# Altium project EXPLORER_V3.PrjPCB
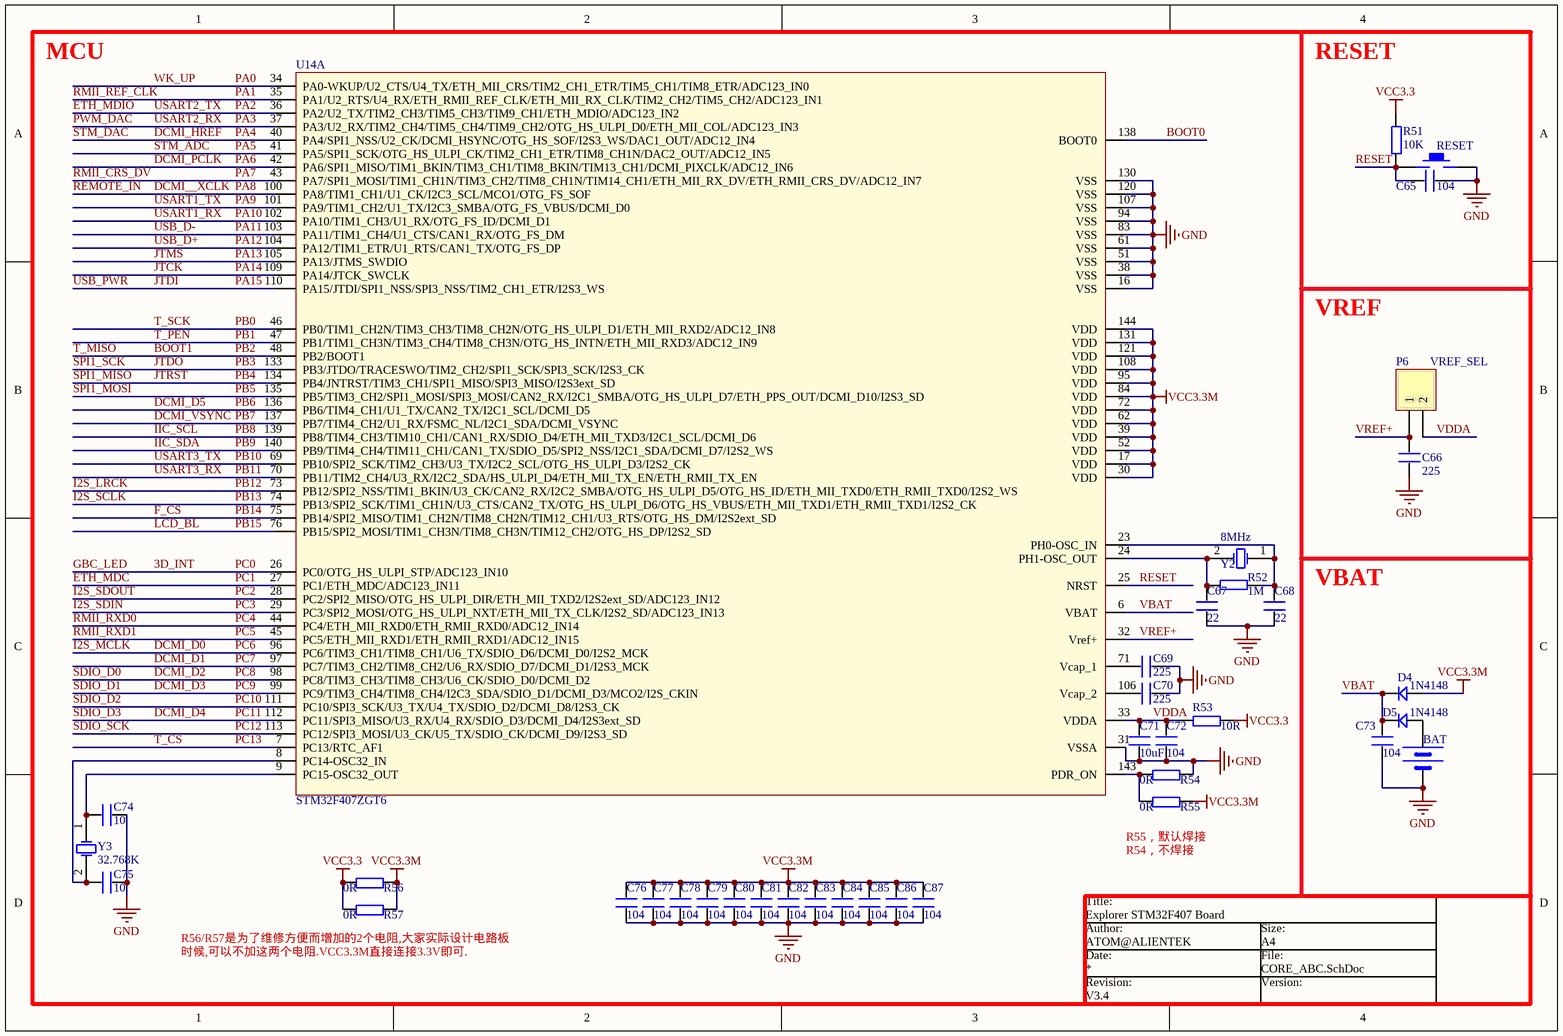
[diagram p0: CORE_ABC.SchDoc]
6 sheets, 254 parts. Net scope: global (net labels, ports and power ports of the same name join across sheets).
Board file: EXPLORER_V3.4.PcbDoc
Sheets:
  CORE_ABC.SchDoc
  CORE_DEFG.SchDoc
  DEVICE1.SchDoc
  DEVICE2.SchDoc
  AUDIO&ETHNET.SchDoc
  POWER&USB_USART.SchDoc

## Sheet CORE_ABC.SchDoc: Explorer STM32F407 Board
size A4; Author: ATOM@ALIENTEK; Revision: V3.4; SheetSize: A4

### Parts
BAT  BATT  [BATM]  (value not drawn)
C65  104  [0402]
C66  225  [0402]
C67  22  [0402]
C68  22  [0402]
C69  225  [0402]
C70  225  [0402]
C71  10uF  [0603P]
C72  104  [0402]
C73  104  [0402]
C74  10  [0402]
C75  10  [0402]
C76  104  [0402]
C77  104  [0402]
C78  104  [0402]
C79  104  [0402]
C80  104  [0402]
C81  104  [0402]
C82  104  [0402]
C83  104  [0402]
C84  104  [0402]
C85  104  [0402]
C86  104  [0402]
C87  104  [0402]
D4  1N4148  [DIODE_SOP]
D5  1N4148  [DIODE_SOP]
P6  VREF_SEL  [HDR1X2]
R51  10K  [0402]
R52  1M  [0402]
R53  10R  [0402]
R54  0R  [0402]
R55  0R  [0402]
R56  0R  [0402]
R57  0R  [0402]
RESET  KEY_M  [KEY_M]  (value not drawn)
U14  STM32F407ZGT6  [LQFP144]  (part A of 2)
Y2  8MHz  [XTAL_US]
Y3  32.768K  [XTAL32]

### Nets
GND: BAT.2(GND) C65.1 C66.1 C67.1 C68.1 C69.2 C70.2 C71.1 C72.1 C73.2 C74.1 C75.1 C76.1 C77.1 C78.1 C79.1 C80.1 C81.1 C82.1 C83.1 C84.1 C85.1 C86.1 C87.1 R54.2 RESET.2 U14.16(VSS) U14.31(VSSA) U14.38(VSS) U14.51(VSS) U14.61(VSS) U14.83(VSS) U14.94(VSS) U14.107(VSS) U14.120(VSS) U14.130(VSS)
VCC3.3: R51.2 R53.2 R56.1 R57.1
VCC3.3M: C76.2 C77.2 C78.2 C79.2 C80.2 C81.2 C82.2 C83.2 C84.2 C85.2 C86.2 C87.2 D4.1 R55.2 R56.2 R57.2 U14.17(VDD) U14.30(VDD) U14.39(VDD) U14.52(VDD) U14.62(VDD) U14.72(VDD) U14.84(VDD) U14.95(VDD) U14.108(VDD) U14.121(VDD) U14.131(VDD) U14.144(VDD)
3D_INT: U14.26(PC0/OTG_HS_ULPI_STP/ADC123_IN10)  [also labelled GBC_LED, PC0]
BOOT0: U14.138(BOOT0)
BOOT1: U14.48(PB2/BOOT1)  [also labelled PB2, T_MISO]
DCMI__XCLK: U14.100(PA8/TIM1_CH1/U1_CK/I2C3_SCL/MCO1/OTG_FS_SOF)  [also labelled PA8, REMOTE_IN]
DCMI_D0: U14.96(PC6/TIM3_CH1/TIM8_CH1/U6_TX/SDIO_D6/DCMI_D0/I2S2_MCK)  [also labelled I2S_MCLK, PC6]
DCMI_D1: U14.97(PC7/TIM3_CH2/TIM8_CH2/U6_RX/SDIO_D7/DCMI_D1/I2S3_MCK)  [also labelled PC7]
DCMI_D2: U14.98(PC8/TIM3_CH3/TIM8_CH3/U6_CK/SDIO_D0/DCMI_D2)  [also labelled PC8, SDIO_D0]
DCMI_D3: U14.99(PC9/TIM3_CH4/TIM8_CH4/I2C3_SDA/SDIO_D1/DCMI_D3/MCO2/I2S_CKIN)  [also labelled PC9, SDIO_D1]
DCMI_D4: U14.112(PC11/SPI3_MISO/U3_RX/U4_RX/SDIO_D3/DCMI_D4/I2S3ext_SD)  [also labelled PC11, SDIO_D3]
DCMI_D5: U14.136(PB6/TIM4_CH1/U1_TX/CAN2_TX/I2C1_SCL/DCMI_D5)  [also labelled PB6]
DCMI_HREF: U14.40(PA4/SPI1_NSS/U2_CK/DCMI_HSYNC/OTG_HS_SOF/I2S3_WS/DAC1_OUT/ADC12_IN4)  [also labelled PA4, STM_DAC]
DCMI_PCLK: U14.42(PA6/SPI1_MISO/TIM1_BKIN/TIM3_CH1/TIM8_BKIN/TIM13_CH1/DCMI_PIXCLK/ADC12_IN6)  [also labelled PA6]
DCMI_VSYNC: U14.137(PB7/TIM4_CH2/U1_RX/FSMC_NL/I2C1_SDA/DCMI_VSYNC)  [also labelled PB7]
ETH_MDC: U14.27(PC1/ETH_MDC/ADC123_IN11)  [also labelled PC1]
ETH_MDIO: U14.36(PA2/U2_TX/TIM2_CH3/TIM5_CH3/TIM9_CH1/ETH_MDIO/ADC123_IN2)  [also labelled PA2, USART2_TX]
F_CS: U14.75(PB14/SPI2_MISO/TIM1_CH2N/TIM8_CH2N/TIM12_CH1/U3_RTS/OTG_HS_DM/I2S2ext_SD)  [also labelled PB14]
I2S_LRCK: U14.73(PB12/SPI2_NSS/TIM1_BKIN/U3_CK/CAN2_RX/I2C2_SMBA/OTG_HS_ULPI_D5/OTG_HS_ID/ETH_MII_TXD0/ETH_RMII_TXD0/I2S2_WS)  [also labelled PB12]
I2S_SCLK: U14.74(PB13/SPI2_SCK/TIM1_CH1N/U3_CTS/CAN2_TX/OTG_HS_ULPI_D6/OTG_HS_VBUS/ETH_MII_TXD1/ETH_RMII_TXD1/I2S2_CK)  [also labelled PB13]
I2S_SDIN: U14.29(PC3/SPI2_MOSI/OTG_HS_ULPI_NXT/ETH_MII_TX_CLK/I2S2_SD/ADC123_IN13)  [also labelled PC3]
I2S_SDOUT: U14.28(PC2/SPI2_MISO/OTG_HS_ULPI_DIR/ETH_MII_TXD2/I2S2ext_SD/ADC123_IN12)  [also labelled PC2]
IIC_SCL: U14.139(PB8/TIM4_CH3/TIM10_CH1/CAN1_RX/SDIO_D4/ETH_MII_TXD3/I2C1_SCL/DCMI_D6)  [also labelled PB8]
IIC_SDA: U14.140(PB9/TIM4_CH4/TIM11_CH1/CAN1_TX/SDIO_D5/SPI2_NSS/I2C1_SDA/DCMI_D7/I2S2_WS)  [also labelled PB9]
JTCK: U14.109(PA14/JTCK_SWCLK)  [also labelled PA14]
JTDI: U14.110(PA15/JTDI/SPI1_NSS/SPI3_NSS/TIM2_CH1_ETR/I2S3_WS)  [also labelled PA15, USB_PWR]
JTDO: U14.133(PB3/JTDO/TRACESWO/TIM2_CH2/SPI1_SCK/SPI3_SCK/I2S3_CK)  [also labelled PB3, SPI1_SCK]
JTMS: U14.105(PA13/JTMS_SWDIO)  [also labelled PA13]
JTRST: U14.134(PB4/JNTRST/TIM3_CH1/SPI1_MISO/SPI3_MISO/I2S3ext_SD)  [also labelled PB4, SPI1_MISO]
LCD_BL: U14.76(PB15/SPI2_MOSI/TIM1_CH3N/TIM8_CH3N/TIM12_CH2/OTG_HS_DP/I2S2_SD)  [also labelled PB15]
PA0: U14.34(PA0-WKUP/U2_CTS/U4_TX/ETH_MII_CRS/TIM2_CH1_ETR/TIM5_CH1/TIM8_ETR/ADC123_IN0)  [also labelled WK_UP]
PA1: U14.35(PA1/U2_RTS/U4_RX/ETH_RMII_REF_CLK/ETH_MII_RX_CLK/TIM2_CH2/TIM5_CH2/ADC123_IN1)  [also labelled RMII_REF_CLK]
PA3: U14.37(PA3/U2_RX/TIM2_CH4/TIM5_CH4/TIM9_CH2/OTG_HS_ULPI_D0/ETH_MII_COL/ADC123_IN3)  [also labelled PWM_DAC, USART2_RX]
PA5: U14.41(PA5/SPI1_SCK/OTG_HS_ULPI_CK/TIM2_CH1_ETR/TIM8_CH1N/DAC2_OUT/ADC12_IN5)  [also labelled STM_ADC]
PA7: U14.43(PA7/SPI1_MOSI/TIM1_CH1N/TIM3_CH2/TIM8_CH1N/TIM14_CH1/ETH_MII_RX_DV/ETH_RMII_CRS_DV/ADC12_IN7)  [also labelled RMII_CRS_DV]
PA9: U14.101(PA9/TIM1_CH2/U1_TX/I2C3_SMBA/OTG_FS_VBUS/DCMI_D0)  [also labelled USART1_TX]
PA10: U14.102(PA10/TIM1_CH3/U1_RX/OTG_FS_ID/DCMI_D1)  [also labelled USART1_RX]
PA11: U14.103(PA11/TIM1_CH4/U1_CTS/CAN1_RX/OTG_FS_DM)  [also labelled USB_D-]
PA12: U14.104(PA12/TIM1_ETR/U1_RTS/CAN1_TX/OTG_FS_DP)  [also labelled USB_D+]
PB0: U14.46(PB0/TIM1_CH2N/TIM3_CH3/TIM8_CH2N/OTG_HS_ULPI_D1/ETH_MII_RXD2/ADC12_IN8)  [also labelled T_SCK]
PB1: U14.47(PB1/TIM1_CH3N/TIM3_CH4/TIM8_CH3N/OTG_HS_INTN/ETH_MII_RXD3/ADC12_IN9)  [also labelled T_PEN]
PB5: U14.135(PB5/TIM3_CH2/SPI1_MOSI/SPI3_MOSI/CAN2_RX/I2C1_SMBA/OTG_HS_ULPI_D7/ETH_PPS_OUT/DCMI_D10/I2S3_SD)  [also labelled SPI1_MOSI]
PB10: U14.69(PB10/SPI2_SCK/TIM2_CH3/U3_TX/I2C2_SCL/OTG_HS_ULPI_D3/I2S2_CK)  [also labelled USART3_TX]
PB11: U14.70(PB11/TIM2_CH4/U3_RX/I2C2_SDA/HS_ULPI_D4/ETH_MII_TX_EN/ETH_RMII_TX_EN)  [also labelled USART3_RX]
PC4: U14.44(PC4/ETH_MII_RXD0/ETH_RMII_RXD0/ADC12_IN14)  [also labelled RMII_RXD0]
PC5: U14.45(PC5/ETH_MII_RXD1/ETH_RMII_RXD1/ADC12_IN15)  [also labelled RMII_RXD1]
PC10: U14.111(PC10/SPI3_SCK/U3_TX/U4_TX/SDIO_D2/DCMI_D8/I2S3_CK)  [also labelled SDIO_D2]
PC12: U14.113(PC12/SPI3_MOSI/U3_CK/U5_TX/SDIO_CK/DCMI_D9/I2S3_SD)  [also labelled SDIO_SCK]
PC13: U14.7(PC13/RTC_AF1)  [also labelled T_CS]
RESET: C65.2 R51.1 RESET.1 U14.25(NRST)
VBAT: C73.1 D4.2 D5.2 U14.6(VBAT)
VDDA: C71.2 C72.2 P6.2 R53.1 U14.33(VDDA)
VREF+: C66.2 P6.1 U14.32(Vref+)
NetBAT_1: BAT.1(VCC) D5.1
NetC67_2: C67.2 R52.2 U14.24(PH1-OSC_OUT) Y2.2(OSC2)
NetC68_2: C68.2 R52.1 U14.23(PH0-OSC_IN) Y2.1(OSC1)
NetC69_1: C69.1 U14.71(Vcap_1)
NetC70_1: C70.1 U14.106(Vcap_2)
NetC74_2: C74.2 U14.9(PC15-OSC32_OUT) Y3.1(OSC1)
NetC75_2: C75.2 U14.8(PC14-OSC32_IN) Y3.2(OSC2)
NetR54_1: R54.1 R55.1 U14.143(PDR_ON)

### Notes on the sheet
- MCU
- RESET
- VREF
- (near C68) VBAT
- (near R55) R55，默认焊接
  R54，不焊接
- (near R57) R56/R57是为了维修方便而增加的2个电阻,大家实际设计电路板
  时候,可以不加这两个电阻.VCC3.3M直接连接3.3V即可.
- Title:
- Author:
- Date:
- Revision:
- Size:
- File:
- Version:

### Library data of the parts
BAT = BAT
C65-C87 = C
D4 D5 = D
P6 = Header 2: Header, 2-Pin; LatestRevisionDate: 17-Jul-2002; LatestRevisionNote: Re-released for DXP Platform.; Publisher: Altium Limited
R51-R57 = R
U14 = STM32F407ZET6
Y2 Y3 = XTAL: Crystal Oscillator; Published: 8-Jun-2000; LatestRevisionDate: 17-Jul-2002; LatestRevisionNote: Re-released for DXP Platform.; Publisher: Altium Limited

## Sheet CORE_DEFG.SchDoc: Explorer STM32F407 Board
size A4; Author: ATOM@ALIENTEK; Revision: V3.4; SheetSize: A4
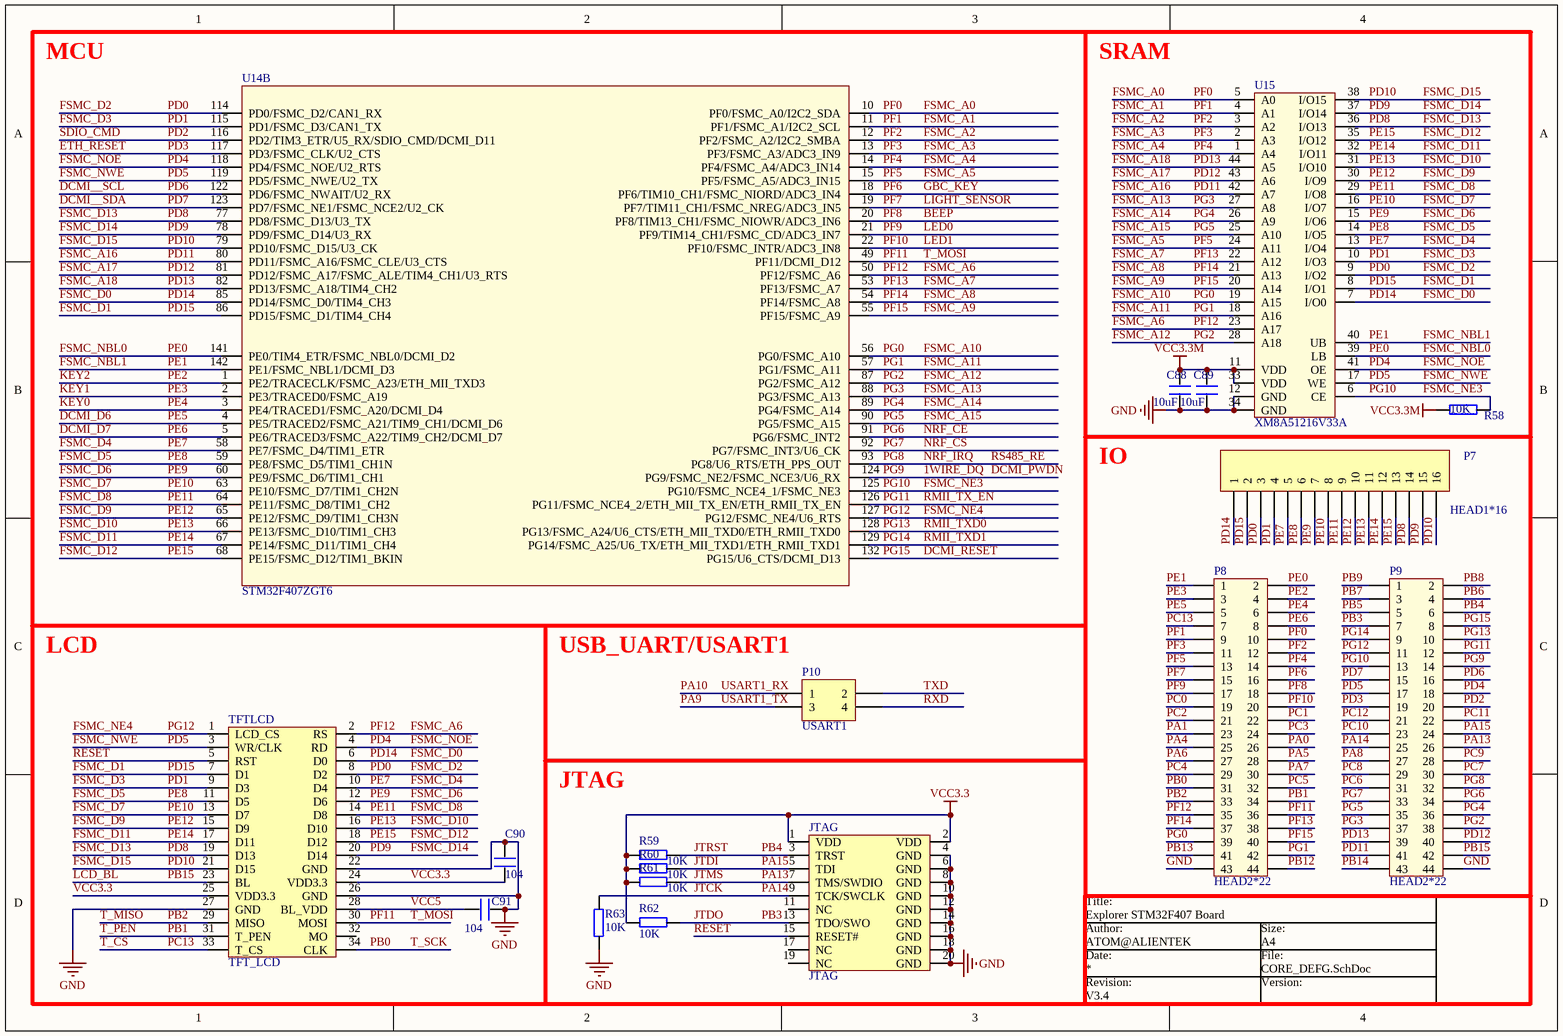
[diagram p1: CORE_DEFG.SchDoc]

### Parts
C88  10uF  [0402]
C89  10uF  [0402]
C90  104  [0402]
C91  104  [0402]
JTAG  JTAG  [JTAG_20]
P7  HEAD1*16  [HDR1X16]
P8  HEAD2*22  [HEAD2*22]
P9  HEAD2*22  [HEAD2*22]
P10  USART1  [HDR2X2]
R58  10K  [0402]
R59  10K  [0402]
R60  10K  [0402]
R61  10K  [0402]
R62  10K  [0402]
R63  10K  [0402]
TFTLCD  TFT_LCD  [db2*17-4.3]
U14  STM32F407ZGT6  [LQFP144]  (part B of 2)
U15  XM8A51216V33A  [TSOP44]

### Nets
GND: C88.1 C89.1 C90.2 C91.1 JTAG.4(GND) JTAG.6(GND) JTAG.8(GND) JTAG.10(GND) JTAG.12(GND) JTAG.14(GND) JTAG.16(GND) JTAG.18(GND) JTAG.20(GND) P8.43 P9.44 R63.2 TFTLCD.22(GND) TFTLCD.26(GND) TFTLCD.27(GND) U15.12(GND) U15.34(GND)
VCC3.3: C90.1 JTAG.1(VDD) JTAG.2(VDD) R59.2 R60.2 R61.2 R62.2 TFTLCD.24(VDD3.3) TFTLCD.25(VDD3.3)
VCC3.3M: C88.2 C89.2 R58.2 U15.11(VDD) U15.33(VDD)
VCC5: C91.2 TFTLCD.28(BL_VDD)
1WIRE_DQ: P9.14 U14.124(PG9/FSMC_NE2/FSMC_NCE3/U6_RX)  [also labelled DCMI_PWDN, PG9]
BEEP: P8.18 U14.20(PF8/TIM13_CH1/FSMC_NIOWR/ADC3_IN6)  [also labelled PF8]
DCMI__SCL: P9.16 U14.122(PD6/FSMC_NWAIT/U2_RX)  [also labelled PD6]
DCMI__SDA: P9.15 U14.123(PD7/FSMC_NE1/FSMC_NCE2/U2_CK)  [also labelled PD7]
DCMI_D6: P8.5 U14.4(PE5/TRACED2/FSMC_A21/TIM9_CH1/DCMI_D6)  [also labelled PE5]
DCMI_D7: P8.8 U14.5(PE6/TRACED3/FSMC_A22/TIM9_CH2/DCMI_D7)  [also labelled PE6]
DCMI_RESET: P9.8 U14.132(PG15/U6_CTS/DCMI_D13)  [also labelled PG15]
ETH_RESET: P9.19 U14.117(PD3/FSMC_CLK/U2_CTS)  [also labelled PD3]
FSMC_A0: P8.10 U14.10(PF0/FSMC_A0/I2C2_SDA) U15.5(A0)  [also labelled PF0]
FSMC_A1: P8.9 U14.11(PF1/FSMC_A1/I2C2_SCL) U15.4(A1)  [also labelled PF1]
FSMC_A2: P8.12 U14.12(PF2/FSMC_A2/I2C2_SMBA) U15.3(A2)  [also labelled PF2]
FSMC_A3: P8.11 U14.13(PF3/FSMC_A3/ADC3_IN9) U15.2(A3)  [also labelled PF3]
FSMC_A4: P8.14 U14.14(PF4/FSMC_A4/ADC3_IN14) U15.1(A4)  [also labelled PF4]
FSMC_A5: P8.13 U14.15(PF5/FSMC_A5/ADC3_IN15) U15.24(A11)  [also labelled PF5]
FSMC_A6: P8.35 TFTLCD.2(RS) U14.50(PF12/FSMC_A6) U15.23(A17)  [also labelled PF12]
FSMC_A7: P8.38 U14.53(PF13/FSMC_A7) U15.22(A12)  [also labelled PF13]
FSMC_A8: P8.37 U14.54(PF14/FSMC_A8) U15.21(A13)  [also labelled PF14]
FSMC_A9: P8.40 U14.55(PF15/FSMC_A9) U15.20(A14)  [also labelled PF15]
FSMC_A10: P8.39 U14.56(PG0/FSMC_A10) U15.19(A15)  [also labelled PG0]
FSMC_A11: P8.42 U14.57(PG1/FSMC_A11) U15.18(A16)  [also labelled PG1]
FSMC_A12: P9.38 U14.87(PG2/FSMC_A12) U15.28(A18)  [also labelled PG2]
FSMC_A13: P9.37 U14.88(PG3/FSMC_A13) U15.27(A8)  [also labelled PG3]
FSMC_A14: P9.36 U14.89(PG4/FSMC_A14) U15.26(A9)  [also labelled PG4]
FSMC_A15: P9.35 U14.90(PG5/FSMC_A15) U15.25(A10)  [also labelled PG5]
FSMC_A16: P9.41 U14.80(PD11/FSMC_A16/FSMC_CLE/U3_CTS) U15.42(A7)  [also labelled PD11]
FSMC_A17: P9.40 U14.81(PD12/FSMC_A17/FSMC_ALE/TIM4_CH1/U3_RTS) U15.43(A6)  [also labelled PD12]
FSMC_A18: P9.39 U14.82(PD13/FSMC_A18/TIM4_CH2) U15.44(A5)  [also labelled PD13]
FSMC_D0: P7.1 TFTLCD.6(D0) U14.85(PD14/FSMC_D0/TIM4_CH3) U15.7(I/O0)  [also labelled PD14]
FSMC_D1: P7.2 TFTLCD.7(D1) U14.86(PD15/FSMC_D1/TIM4_CH4) U15.8(I/O1)  [also labelled PD15]
FSMC_D2: P7.3 TFTLCD.8(D2) U14.114(PD0/FSMC_D2/CAN1_RX) U15.9(I/O2)  [also labelled PD0]
FSMC_D3: P7.4 TFTLCD.9(D3) U14.115(PD1/FSMC_D3/CAN1_TX) U15.10(I/O3)  [also labelled PD1]
FSMC_D4: P7.5 TFTLCD.10(D4) U14.58(PE7/FSMC_D4/TIM1_ETR) U15.13(I/O4)  [also labelled PE7]
FSMC_D5: P7.6 TFTLCD.11(D5) U14.59(PE8/FSMC_D5/TIM1_CH1N) U15.14(I/O5)  [also labelled PE8]
FSMC_D6: P7.7 TFTLCD.12(D6) U14.60(PE9/FSMC_D6/TIM1_CH1) U15.15(I/O6)  [also labelled PE9]
FSMC_D7: P7.8 TFTLCD.13(D7) U14.63(PE10/FSMC_D7/TIM1_CH2N) U15.16(I/O7)  [also labelled PE10]
FSMC_D8: P7.9 TFTLCD.14(D8) U14.64(PE11/FSMC_D8/TIM1_CH2) U15.29(I/O8)  [also labelled PE11]
FSMC_D9: P7.10 TFTLCD.15(D9) U14.65(PE12/FSMC_D9/TIM1_CH3N) U15.30(I/O9)  [also labelled PE12]
FSMC_D10: P7.11 TFTLCD.16(D10) U14.66(PE13/FSMC_D10/TIM1_CH3) U15.31(I/O10)  [also labelled PE13]
FSMC_D11: P7.12 TFTLCD.17(D11) U14.67(PE14/FSMC_D11/TIM1_CH4) U15.32(I/O11)  [also labelled PE14]
FSMC_D12: P7.13 TFTLCD.18(D12) U14.68(PE15/FSMC_D12/TIM1_BKIN) U15.35(I/O12)  [also labelled PE15]
FSMC_D13: P7.14 TFTLCD.19(D13) U14.77(PD8/FSMC_D13/U3_TX) U15.36(I/O13)  [also labelled PD8]
FSMC_D14: P7.15 TFTLCD.20(D14) U14.78(PD9/FSMC_D14/U3_RX) U15.37(I/O14)  [also labelled PD9]
FSMC_D15: P7.16 TFTLCD.21(D15) U14.79(PD10/FSMC_D15/U3_CK) U15.38(I/O15)  [also labelled PD10]
FSMC_NBL0: P8.2 U14.141(PE0/TIM4_ETR/FSMC_NBL0/DCMI_D2) U15.39(LB)  [also labelled PE0]
FSMC_NBL1: P8.1 U14.142(PE1/FSMC_NBL1/DCMI_D3) U15.40(UB)  [also labelled PE1]
FSMC_NE3: P9.13 R58.1 U14.125(PG10/FSMC_NCE4_1/FSMC_NE3) U15.6(CE)  [also labelled PG10]
FSMC_NE4: P9.11 TFTLCD.1(LCD_CS) U14.127(PG12/FSMC_NE4/U6_RTS)  [also labelled PG12]
FSMC_NOE: P9.18 TFTLCD.4(RD) U14.118(PD4/FSMC_NOE/U2_RTS) U15.41(OE)  [also labelled PD4]
FSMC_NWE: P9.17 TFTLCD.3(WR/CLK) U14.119(PD5/FSMC_NWE/U2_TX) U15.17(WE)  [also labelled PD5]
GBC_KEY: P8.16 U14.18(PF6/TIM10_CH1/FSMC_NIORD/ADC3_IN4)  [also labelled PF6]
JTCK: JTAG.9(TCK/SWCLK) P9.25 R63.1  [also labelled PA14]
JTDI: JTAG.5(TDI) P9.24 R60.1  [also labelled PA15]
JTDO: JTAG.13(TDO/SWO) P9.7 R62.1  [also labelled PB3]
JTMS: JTAG.7(TMS/SWDIO) P9.26 R61.1  [also labelled PA13]
JTRST: JTAG.3(TRST) P9.6 R59.1  [also labelled PB4]
KEY0: P8.6 U14.3(PE4/TRACED1/FSMC_A20/DCMI_D4)  [also labelled PE4]
KEY1: P8.3 U14.2(PE3/TRACED0/FSMC_A19)  [also labelled PE3]
KEY2: P8.4 U14.1(PE2/TRACECLK/FSMC_A23/ETH_MII_TXD3)  [also labelled PE2]
LCD_BL: P9.42 TFTLCD.23(BL)  [also labelled PB15]
LED0: P8.17 U14.21(PF9/TIM14_CH1/FSMC_CD/ADC3_IN7)  [also labelled PF9]
LED1: P8.20 U14.22(PF10/FSMC_INTR/ADC3_IN8)  [also labelled PF10]
LIGHT_SENSOR: P8.15 U14.19(PF7/TIM11_CH1/FSMC_NREG/ADC3_IN5)  [also labelled PF7]
NRF_CE: P9.34 U14.91(PG6/FSMC_INT2)  [also labelled PG6]
NRF_CS: P9.33 U14.92(PG7/FSMC_INT3/U6_CK)  [also labelled PG7]
NRF_IRQ: P9.32 U14.93(PG8/U6_RTS/ETH_PPS_OUT)  [also labelled PG8, RS485_RE]
PA0: P8.26
PA1: P8.23
PA4: P8.25  [project net DCMI_HREF]
PA5: P8.28
PA6: P8.27  [project net DCMI_PCLK]
PA7: P8.30
PA8: P9.27  [project net DCMI__XCLK]
PA9: P10.3  [also labelled USART1_TX]
PA10: P10.1  [also labelled USART1_RX]
PB0: P8.31 TFTLCD.34(CLK)  [also labelled T_SCK]
PB1: P8.34 TFTLCD.31(T_PEN)  [also labelled T_PEN]
PB2: P8.33 TFTLCD.29(MISO)  [also labelled T_MISO]  [project net BOOT1]
PB5: P9.5
PB6: P9.4  [project net DCMI_D5]
PB7: P9.3  [project net DCMI_VSYNC]
PB8: P9.2  [project net IIC_SCL]
PB9: P9.1  [project net IIC_SDA]
PB12: P8.44  [project net I2S_LRCK]
PB13: P8.41  [project net I2S_SCLK]
PB14: P9.43  [project net F_CS]
PC0: P8.19  [project net 3D_INT]
PC1: P8.22  [project net ETH_MDC]
PC2: P8.21  [project net I2S_SDOUT]
PC3: P8.24  [project net I2S_SDIN]
PC4: P8.29
PC5: P8.32
PC6: P9.31  [project net DCMI_D0]
PC7: P9.30  [project net DCMI_D1]
PC8: P9.29  [project net DCMI_D2]
PC9: P9.28  [project net DCMI_D3]
PC10: P9.23
PC11: P9.22  [project net DCMI_D4]
PC12: P9.21
PC13: P8.7 TFTLCD.33(T_CS)  [also labelled T_CS]
PD2: P9.20 U14.116(PD2/TIM3_ETR/U5_RX/SDIO_CMD/DCMI_D11)  [also labelled SDIO_CMD]
PF11: P8.36 TFTLCD.30(MOSI) U14.49(PF11/DCMI_D12)  [also labelled T_MOSI]
PG11: P9.12 U14.126(PG11/FSMC_NCE4_2/ETH_MII_TX_EN/ETH_RMII_TX_EN)  [also labelled RMII_TX_EN]
PG13: P9.10 U14.128(PG13/FSMC_A24/U6_CTS/ETH_MII_TXD0/ETH_RMII_TXD0)  [also labelled RMII_TXD0]
PG14: P9.9 U14.129(PG14/FSMC_A25/U6_TX/ETH_MII_TXD1/ETH_RMII_TXD1)  [also labelled RMII_TXD1]
RESET: JTAG.15(RESET#) TFTLCD.5(RST)
RXD: P10.4
TXD: P10.2

Not connected (* = marked no-connect by the designer): JTAG 11(NC) 17(NC) 19(NC); TFTLCD 32(MO)

### Notes on the sheet
- MCU
- SRAM
- IO
- LCD
- USB_UART/USART1
- JTAG
- Title:
- Author:
- Date:
- Revision:
- Size:
- File:
- Version:

### Library data of the parts
C88-C91 = C
P7 = Header 16: Header, 16-Pin; LatestRevisionDate: 17-Jul-2002; LatestRevisionNote: Re-released for DXP Platform.; Publisher: Altium Limited
P10 = Header 2X2: Header, 2-Pin, Dual row; LatestRevisionDate: 17-Jul-2002; LatestRevisionNote: Re-released for DXP Platform.; Publisher: Altium Limited
R58-R63 = R
U14 = STM32F407ZET6
U15 = IS62WV51216

## Sheet DEVICE1.SchDoc: Explorer STM32F407 Board
size A4; Author: ATOM@ALIENTEK; Revision: V3.4; SheetSize: A4
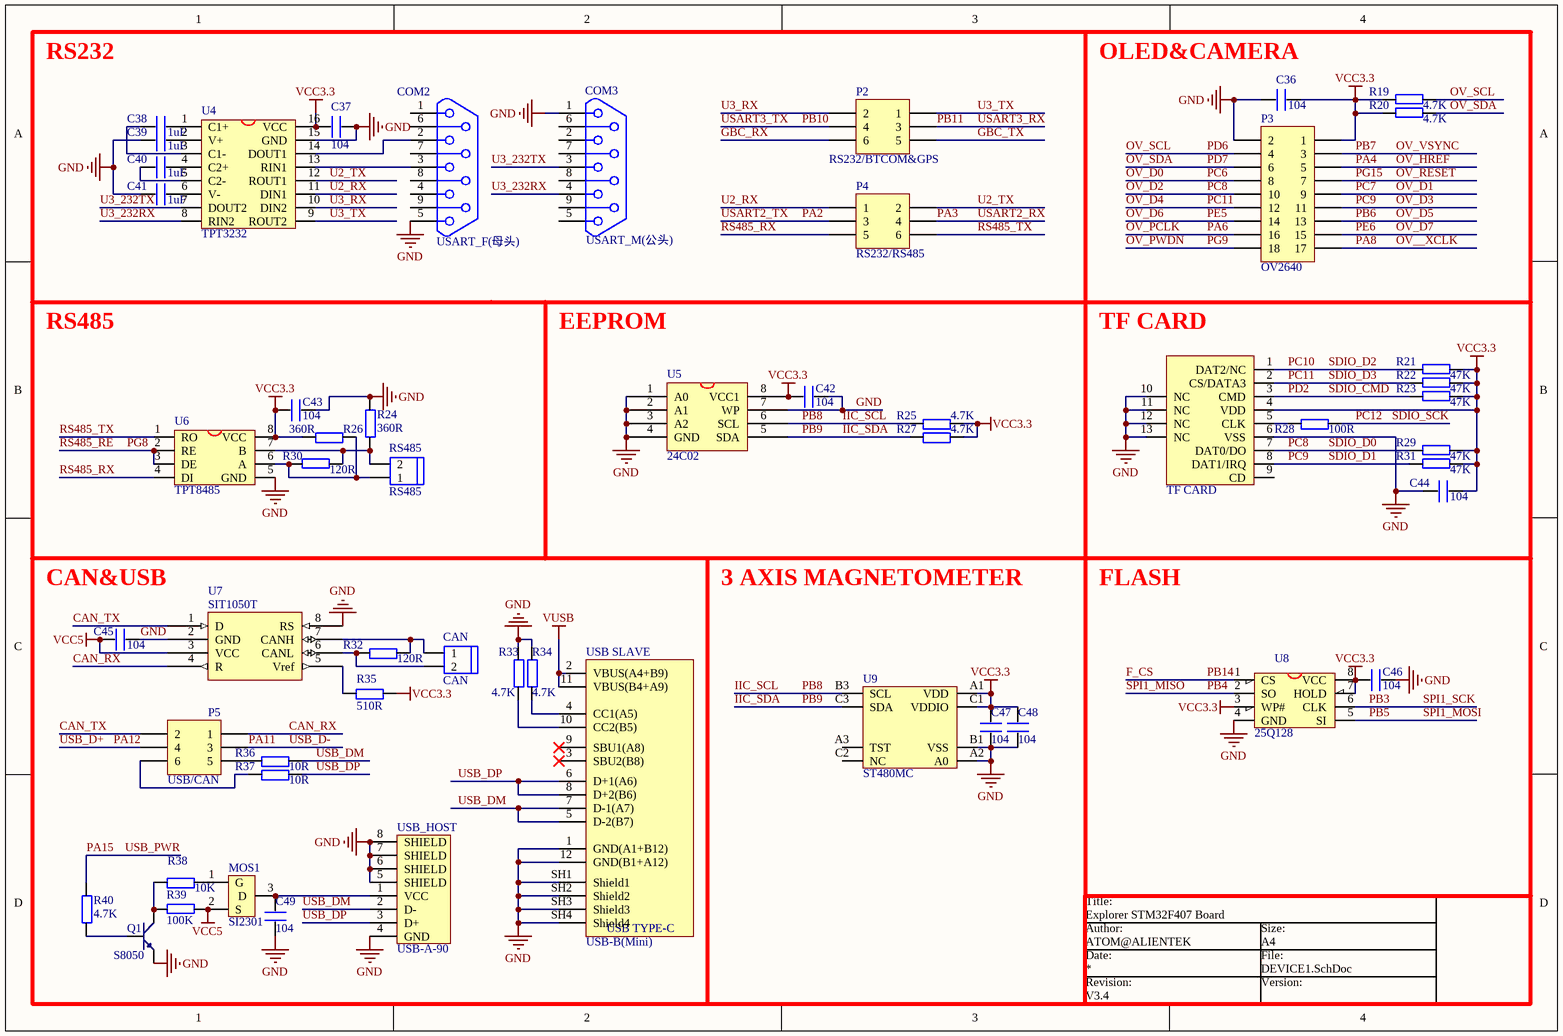
[diagram p2: DEVICE1.SchDoc]

### Parts
C36  104  [0402]
C37  104  [0402]
C38  1uF  [0402]
C39  1uF  [0402]
C40  1uF  [0402]
C41  1uF  [0402]
C42  104  [0402]
C43  104  [0402]
C44  104  [0402]
C45  104  [0402]
C46  104  [0402]
C47  104  [0603P]
C48  104  [0603P]
C49  104  [0402]
CAN  CAN  [HEAD2L-0.8]
COM2  USART_F(母头)  [DB9]
COM3  USART_M(公头)  [DB9]
MOS1  SI2301  [SO-G3/C2.5]
P2  RS232/BTCOM&GPS  [HDR2X3]
P3  OV2640  [HDR2X9]
P4  RS232/RS485  [HDR2X3]
P5  USB/CAN  [HDR2X3]
Q1  S8050  [SOT-23R]
R19  4.7K  [0402]
R20  4.7K  [0402]
R21  47K  [0402]
R22  47K  [0402]
R23  47K  [0402]
R24  360R  [0402]
R25  4.7K  [0402]
R26  360R  [0402]
R27  4.7K  [0402]
R28  100R  [0402]
R29  47K  [0402]
R30  120R  [0402]
R31  47K  [0402]
R32  120R  [0402]
R33  4.7K  [0402]
R34  4.7K  [0402]
R35  510R  [0402]
R36  10R  [0402]
R37  10R  [0402]
R38  10K  [0402]
R39  100K  [0402]
R40  4.7K  [0402]
RS485  RS485  [HEAD2L-0.8]
TF_CARD  SD-MICRO-TF  [SD-MICRO-TF]  (value not drawn)
U4  TPT3232  [SOP16M]
U5  24C02  [SOP-8]
U6  TPT8485  [SOP-8]
U7  SIT1050T  [SOP-8]
U8  25Q128  [SOIC-8]
U9  ST480MC  [ST480MC]
USB_HOST  USB-A-90  [USB-A-90]
USB_SLAVE  USB-B(Mini)  [USB Type-C]

### Nets
GND: C36.2 C37.2 C39.2 C41.1 C42.1 C43.1 C44.1 C45.2 C46.2 C47.1 C48.1 C49.1 COM2.5 COM3.1 P3.2 Q1.1(E) R24.2 R33.2 R34.2 TF_CARD.6(VSS) TF_CARD.10(NC) TF_CARD.11(NC) TF_CARD.12(NC) TF_CARD.13(NC) U4.15(GND) U5.1(A0) U5.2(A1) U5.3(A2) U5.4(GND) U5.7(WP) U6.5(GND) U7.2(GND) U7.8(RS) U8.4(GND) U9.A2(A0) U9.B1(VSS) USB_HOST.4(GND) USB_HOST.5(SHIELD) USB_HOST.6(SHIELD) USB_HOST.7(SHIELD) USB_HOST.8(SHIELD) USB_SLAVE.1(GND(A1+B12)) USB_SLAVE.12(GND(B1+A12)) USB_SLAVE.SH1(Shield1) USB_SLAVE.SH2(Shield2) USB_SLAVE.SH3(Shield3) USB_SLAVE.SH4(Shield4)
VCC3.3: C36.1 C37.1 C42.2 C43.2 C44.2 C46.1 C47.2 C48.2 P3.1 R19.2 R20.2 R21.1 R22.1 R23.1 R25.2 R26.1 R27.2 R29.1 R31.1 R35.2 TF_CARD.4(VDD) U4.16(VCC) U5.8(VCC1) U6.8(VCC) U8.3(WP#) U8.7(HOLD) U8.8(VCC) U9.A1(VDD) U9.C1(VDDIO)
VCC5: C45.1 MOS1.2(S) R39.1 U7.3(VCC)
VUSB: USB_SLAVE.2(VBUS(A4+B9)) USB_SLAVE.11(VBUS(B4+A9))
CAN_RX: P5.1 U7.4(R)
CAN_TX: P5.2 U7.1(D)
F_CS: U8.1(CS)  [also labelled PB14]
GBC_RX: P2.6
GBC_TX: P2.5
IIC_SCL: R25.1 U5.6(SCL) U9.B3(SCL)  [also labelled PB8]
IIC_SDA: R27.1 U5.5(SDA) U9.C3(SDA)  [also labelled PB9]
OV__XCLK: P3.17  [also labelled PA8]  [project net DCMI__XCLK]
OV_D0: P3.8  [also labelled PC6]  [project net DCMI_D0]
OV_D1: P3.9  [also labelled PC7]  [project net DCMI_D1]
OV_D2: P3.10 R29.2 TF_CARD.7(DAT0/DO)  [also labelled PC8, SDIO_D0]  [project net DCMI_D2]
OV_D3: P3.11 R31.2 TF_CARD.8(DAT1/IRQ)  [also labelled PC9, SDIO_D1]  [project net DCMI_D3]
OV_D4: P3.12 R22.2 TF_CARD.2(CS/DATA3)  [also labelled PC11, SDIO_D3]  [project net DCMI_D4]
OV_D5: P3.13  [also labelled PB6]  [project net DCMI_D5]
OV_D6: P3.14  [also labelled PE5]  [project net DCMI_D6]
OV_D7: P3.15  [also labelled PE6]  [project net DCMI_D7]
OV_HREF: P3.5  [also labelled PA4]  [project net DCMI_HREF]
OV_PCLK: P3.16  [also labelled PA6]  [project net DCMI_PCLK]
OV_PWDN: P3.18  [also labelled PG9]  [project net 1WIRE_DQ]
OV_RESET: P3.7  [also labelled PG15]  [project net DCMI_RESET]
OV_SCL: P3.4 R19.1  [also labelled PD6]  [project net DCMI__SCL]
OV_SDA: P3.6 R20.1  [also labelled PD7]  [project net DCMI__SDA]
OV_VSYNC: P3.3  [also labelled PB7]  [project net DCMI_VSYNC]
PA2: P4.3  [also labelled USART2_TX]  [project net ETH_MDIO]
PA3: P4.4  [also labelled USART2_RX]
PA11: P5.3  [also labelled USB_D-]
PA12: P5.4  [also labelled USB_D+]
PA15: R40.2  [also labelled USB_PWR]  [project net JTDI]
PB3: U8.6(CLK)  [also labelled SPI1_SCK]  [project net JTDO]
PB4: U8.2(SO)  [also labelled SPI1_MISO]  [project net JTRST]
PB5: U8.5(SI)  [also labelled SPI1_MOSI]
PB10: P2.4  [also labelled USART3_TX]
PB11: P2.3  [also labelled USART3_RX]
PC10: R21.2 TF_CARD.1(DAT2/NC)  [also labelled SDIO_D2]
PC12: R28.2  [also labelled SDIO_SCK]
PD2: R23.2 TF_CARD.3(CMD)  [also labelled SDIO_CMD]
PG8: U6.2(RE) U6.3(DE)  [also labelled RS485_RE]  [project net NRF_IRQ]
RS485_RX: P4.5 U6.4(DI)
RS485_TX: P4.6 U6.1(RO)
U2_RX: P4.1 U4.11(DIN1)
U2_TX: P4.2 U4.12(ROUT1)
U3_232RX: COM3.4 U4.8(RIN2)
U3_232TX: COM3.3 U4.7(DOUT2)
U3_RX: P2.2 U4.10(DIN2)
U3_TX: P2.1 U4.9(ROUT2)
USB_DM: R36.2 USB_HOST.2(D-) USB_SLAVE.5(D-2(B7)) USB_SLAVE.7(D-1(A7))
USB_DP: R37.2 USB_HOST.3(D+) USB_SLAVE.6(D+1(A6)) USB_SLAVE.8(D+2(B6))
NetC38_1: C38.1 U4.1(C1+)
NetC38_2: C38.2 U4.3(C1-)
NetC39_1: C39.1 U4.2(V+)
NetC40_1: C40.1 U4.5(C2-)
NetC40_2: C40.2 U4.4(C2+)
NetC41_2: C41.2 U4.6(V-)
NetC49_2: C49.2 MOS1.3(D) USB_HOST.1(VCC)
NetCAN_1: CAN.1 R32.2 U7.7(CANH)
NetCAN_2: CAN.2 R32.1 U7.6(CANL)
NetCOM2_2: COM2.2 U4.14(DOUT1)
NetCOM2_3: COM2.3 U4.13(RIN1)
NetMOS1_1: MOS1.1(G) R38.2
NetP5_5: P5.5 R36.1
NetP5_6: P5.6 R37.1
NetQ1_2: Q1.2(B) R40.1
NetQ1_3: Q1.3(C) R38.1 R39.2
NetR24_1: R24.1 R30.1 RS485.2 U6.7(B)
NetR26_2: R26.2 R30.2 RS485.1 U6.6(A)
NetR28_1: R28.1 TF_CARD.5(CLK)
NetR33_1: R33.1 USB_SLAVE.10(CC2(B5))
NetR34_1: R34.1 USB_SLAVE.4(CC1(A5))
NetR35_1: R35.1 U7.5(Vref)

Not connected (* = marked no-connect by the designer): COM2 1 4 6 7 8 9; COM3 2 5 6 7 8 9; TF_CARD 9(CD); U9 A3(TST) C2(NC); USB_SLAVE 3(SBU2(B8))* 9(SBU1(A8))*

### Notes on the sheet
- RS232
- OLED&CAMERA
- RS485
- EEPROM
- (near TF_CARD) TF CARD
- (near C45) CAN&USB
- 3 AXIS MAGNETOMETER
- FLASH
- Title:
- Author:
- Date:
- Revision:
- Size:
- File:
- Version:
- (in symbol USB Type-C) USB TYPE-C

### Library data of the parts
C36-C49 = C
CAN RS485 = HEAD2
COM2 COM3 = DB9
MOS1 = MOS-P: IRLML6401/SI2301
P2 P4 P5 = Header 3X2: Header, 3-Pin, Dual row; LatestRevisionDate: 17-Jul-2002; LatestRevisionNote: Re-released for DXP Platform.; Publisher: Altium Limited
P3 = Header 9X2: Header, 9-Pin, Dual row; LatestRevisionDate: 17-Jul-2002; LatestRevisionNote: Re-released for DXP Platform.; Publisher: Altium Limited
Q1 = NPN: 8050/BCW846/BCW847
R19-R40 = R
TF_CARD = SD-MICRO-TF: SD,MICRO,TF
U4 = MAX3232
U5 = 24C256
U6 = MAX3485
U7 = SN65HVD230D
U8 = W25X16: W25X16;SST25VF016;MX25L1605
U9 = ST480MC: 三轴磁力计
USB_HOST = USB_A_90
USB_SLAVE = USB Type-C: 12P TypeC 母座

## Sheet DEVICE2.SchDoc: Explorer STM32F407 Board
size A4; Author: ATOM@ALIENTEK; Revision: V3.4; SheetSize: A4
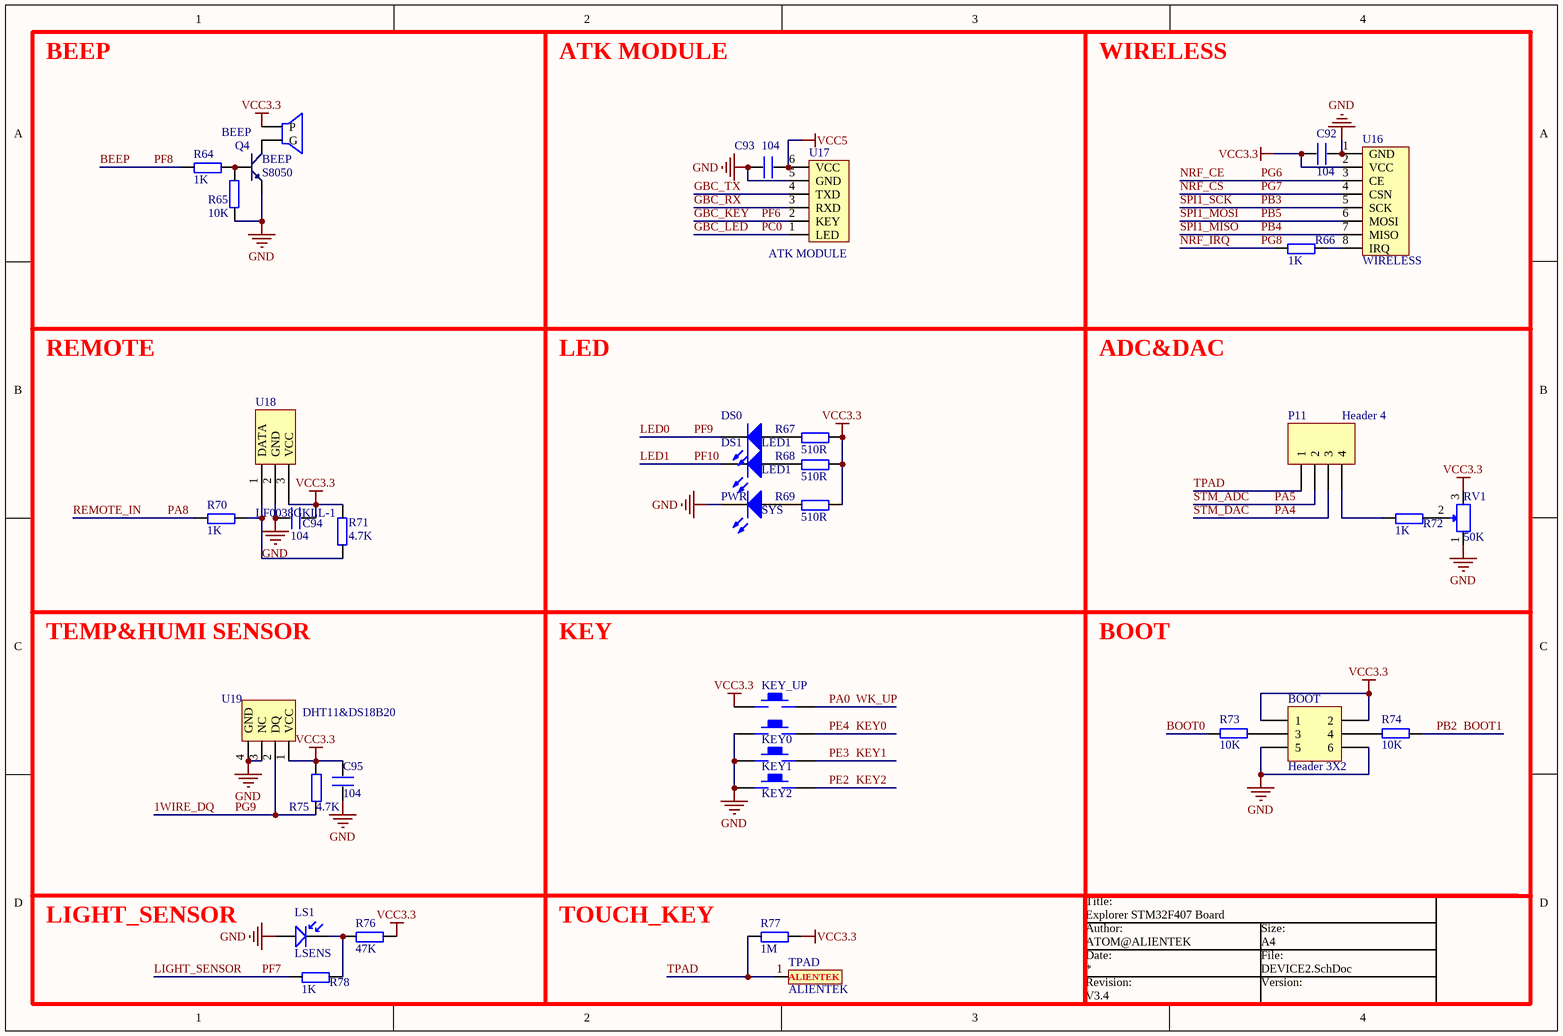
[diagram p3: DEVICE2.SchDoc]

### Parts
BEEP  BEEP  [BELL-5]
BOOT  Header 3X2  [HDR2X3]
C92  104  [0402]
C93  104  [0402]
C94  104  [0402]
C95  104  [0402]
DS0  LED1  [SMDLED]
DS1  LED1  [SMDLED]
KEY0  KEY_M  [KEY_M]  (value not drawn)
KEY1  KEY_M  [KEY_M]  (value not drawn)
KEY2  KEY_M  [KEY_M]  (value not drawn)
KEY_UP  KEY_M  [KEY_M]  (value not drawn)
LS1  LSENS  [SMDLED]
P11  Header 4  [HDR1X4]
PWR  SYS  [SMDLED]
Q4  S8050  [SOT-23R]
R64  1K  [0402]
R65  10K  [0402]
R66  1K  [0402]
R67  510R  [0402]
R68  510R  [0402]
R69  510R  [0402]
R70  1K  [0402]
R71  4.7K  [0402]
R72  1K  [0402]
R73  10K  [0402]
R74  10K  [0402]
R75  4.7K  [0402]
R76  47K  [0402]
R77  1M  [0402]
R78  1K  [0402]
RV1  50K  [RV]
TPAD  ALIENTEK  [ATK_TPAD]
U16  WIRELESS  [NRF24L01]
U17  ATK MODULE  [HEAD6]
U18  LF0038GKLL-1  [IR-LF0038GKLL-1]
U19  DHT11&DS18B20  [DHT11]

### Nets
GND: BOOT.5 BOOT.6 C92.1 C93.2 C94.2 C95.2 KEY0.1 KEY1.1 KEY2.1 LS1.1 PWR.2(K) Q4.1(E) R65.2 RV1.1 U16.1(GND) U17.5(GND) U18.2(GND) U19.3(NC) U19.4(GND)
VCC3.3: BEEP.1(P) BOOT.1 BOOT.2 C92.2 C94.1 C95.1 KEY_UP.1 R67.2 R68.2 R69.2 R71.1 R75.2 R76.2 R77.2 RV1.3 U16.2(VCC) U18.3(VCC) U19.1(VCC)
VCC5: C93.1 U17.6(VCC)
1WIRE_DQ: R75.1 U19.2(DQ)  [also labelled PG9]
BEEP: R64.1  [also labelled PF8]
BOOT0: R73.2
BOOT1: R74.1  [also labelled PB2]
GBC_KEY: U17.2(KEY)  [also labelled PF6]
GBC_LED: U17.1(LED)  [also labelled PC0]  [project net 3D_INT]
GBC_RX: U17.3(RXD)
GBC_TX: U17.4(TXD)
KEY0: KEY0.2  [also labelled PE4]
KEY1: KEY1.2  [also labelled PE3]
KEY2: KEY2.2  [also labelled PE2]
LED0: DS0.2(K)  [also labelled PF9]
LED1: DS1.2(K)  [also labelled PF10]
LIGHT_SENSOR: R78.1  [also labelled PF7]
NRF_CE: U16.3(CE)  [also labelled PG6]
NRF_CS: U16.4(CSN)  [also labelled PG7]
NRF_IRQ: R66.1  [also labelled PG8]
PA0: KEY_UP.2  [also labelled WK_UP]
PA4: P11.3  [also labelled STM_DAC]  [project net DCMI_HREF]
PA5: P11.2  [also labelled STM_ADC]
PA8: R70.1  [also labelled REMOTE_IN]  [project net DCMI__XCLK]
PB3: U16.5(SCK)  [also labelled SPI1_SCK]  [project net JTDO]
PB4: U16.7(MISO)  [also labelled SPI1_MISO]  [project net JTRST]
PB5: U16.6(MOSI)  [also labelled SPI1_MOSI]
TPAD: P11.1 R77.1 TPAD.1
NetBEEP_2: BEEP.2(G) Q4.3(C)
NetBOOT_3: BOOT.3 R73.1
NetBOOT_4: BOOT.4 R74.2
NetDS0_1: DS0.1(A) R67.1
NetDS1_1: DS1.1(A) R68.1
NetLS1_2: LS1.2 R76.1 R78.2
NetP11_4: P11.4 R72.1
NetPWR_1: PWR.1(A) R69.1
NetQ4_2: Q4.2(B) R64.2 R65.1
NetR66_2: R66.2 U16.8(IRQ)
NetR70_2: R70.2 R71.2 U18.1(DATA)
NetR72_2: R72.2 RV1.2

### Notes on the sheet
- BEEP
- ATK MODULE
- WIRELESS
- REMOTE
- LED
- ADC&DAC
- TEMP&HUMI SENSOR
- KEY
- BOOT
- LIGHT_SENSOR
- TOUCH_KEY
- Title:
- Author:
- Date:
- Revision:
- Size:
- File:
- Version:

### Library data of the parts
BOOT = Header 3X2: Header, 3-Pin, Dual row; LatestRevisionDate: 17-Jul-2002; LatestRevisionNote: Re-released for DXP Platform.; Publisher: Altium Limited
C92-C95 = C
DS0 DS1 PWR = LED2: Typical RED, GREEN, YELLOW, AMBER GaAs LED; Published: 8-Jun-2000; LatestRevisionDate: 17-Jul-2002; LatestRevisionNote: Re-released for DXP Platform.; PackageDocument: Feb-2002; PackageReference: 3.2X1.6X1.1; Publisher: Altium Limited
LS1 = LSENS: LIGHT SENS
P11 = Header 4: Header, 4-Pin; LatestRevisionDate: 17-Jul-2002; LatestRevisionNote: Re-released for DXP Platform.; Publisher: Altium Limited
Q4 = NPN: 8050/BCW846/BCW847
R64-R78 = R
RV1 = RV
U16 = NRF24L01
U17 = ATK-HC05
U18 = HS0038
U19 = DHT11: 数字温湿度传感器

## Sheet AUDIO&ETHNET.SchDoc: Explorer STM32F407 Board
size A4; Author: ATOM@ALIENTEK; Revision: V3.4; SheetSize: A4
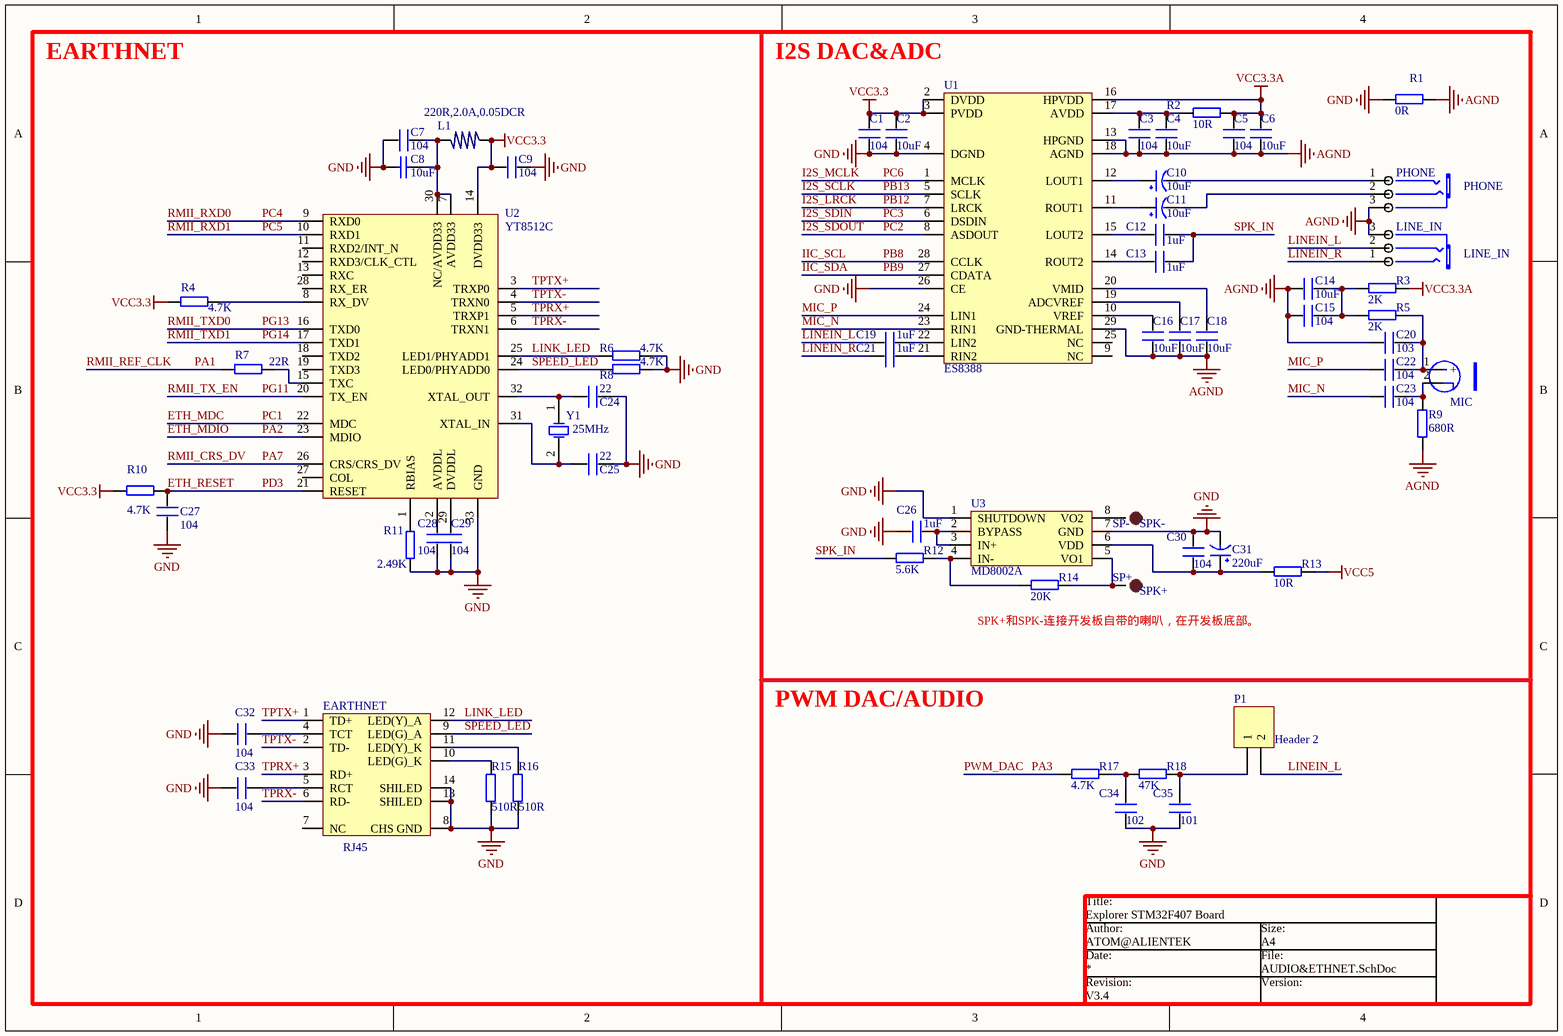
[diagram p4: AUDIO&ETHNET.SchDoc]

### Parts
C1  104  [0402]
C2  10uF  [0603P]
C3  104  [0402]
C4  10uF  [0603P]
C5  104  [0402]
C6  10uF  [0603P]
C7  104  [0402]
C8  10uF  [0603P]
C9  104  [0402]
C10  10uF  [0603P]
C11  10uF  [0603P]
C12  1uF  [0402]
C13  1uF  [0402]
C14  10uF  [0603P]
C15  104  [0402]
C16  10uF  [0603P]
C17  10uF  [0603P]
C18  10uF  [0603P]
C19  1uF  [0402]
C20  103  [0402]
C21  1uF  [0402]
C22  104  [0402]
C23  104  [0402]
C24  22  [0402]
C25  22  [0402]
C26  1uF  [0402]
C27  104  [0402]
C28  104  [0402]
C29  104  [0402]
C30  104  [0402]
C31  220uF  [CC6.56.5]
C32  104  [0402]
C33  104  [0402]
C34  102  [0402]
C35  101  [0402]
EARTHNET  RJ45  [HR911105A]
L1  220R,2.0A,0.05DCR  [0603P]
LINE_IN  LINE_IN  [PHONE_ST]
MIC1  MIC  [MIC-6022]
P1  Header 2  [HDR1X2]
PHONE  PHONE  [PHONE_ST]
R1  0R  [0402]
R2  10R  [0402]
R3  2K  [0402]
R4  4.7K  [0402]
R5  2K  [0402]
R6  4.7K  [0402]
R7  22R  [0402]
R8  4.7K  [0402]
R9  680R  [0402]
R10  4.7K  [0402]
R11  2.49K  [0402]
R12  5.6K  [0402]
R13  10R  [0402]
R14  20K  [0402]
R15  510R  [0402]
R16  510R  [0402]
R17  4.7K  [0402]
R18  47K  [0402]
SP+  SPK+  [TP-1.5]
SP-  SPK-  [TP-1.5]
U1  ES8388  [qfn28]
U2  YT8512C  [YT8512C]
U3  MD8002A  [SOP-8]
Y1  25MHz  [XTAL_US]

### Nets
AGND: C3.1 C4.1 C5.1 C6.1 C14.2 C15.1 C16.1 C17.1 C18.1 C20.2 LINE_IN.3(COM) PHONE.3(COM) R1.1 R9.2 U1.13(HPGND) U1.18(AGND) U1.29(GND-THERMAL)
GND: C1.1 C2.1 C7.1 C8.2 C9.1 C24.1 C25.1 C26.1 C27.1 C28.1 C29.1 C30.2 C31.2(GND) C32.1 C33.1 C34.1 C35.1 EARTHNET.8(CHS_GND) EARTHNET.13(SHILED) EARTHNET.14(SHILED) R1.2 R6.1 R8.1 R11.2 R15.2 R16.2 U1.4(DGND) U1.26(CE) U2.33(GND) U3.1(SHUTDOWN) U3.7(GND)
VCC3.3: C1.2 C2.2 C9.2 L1.1 R4.2 R10.2 U1.2(DVDD) U1.3(PVDD) U2.14(DVDD33)
VCC3.3A: C5.2 C6.2 R2.1 R3.1 U1.16(HPVDD)
VCC5: R13.1
ETH_MDC: U2.22(MDC)  [also labelled PC1]
ETH_MDIO: U2.23(MDIO)  [also labelled PA2]
ETH_RESET: C27.2 R10.1 U2.21(RESET)  [also labelled PD3]
I2S_LRCK: U1.7(LRCK)  [also labelled PB12]
I2S_MCLK: U1.1(MCLK)  [also labelled PC6]  [project net DCMI_D0]
I2S_SCLK: U1.5(SCLK)  [also labelled PB13]
I2S_SDIN: U1.6(DSDIN)  [also labelled PC3]
I2S_SDOUT: U1.8(ASDOUT)  [also labelled PC2]
IIC_SCL: U1.28(CCLK)  [also labelled PB8]
IIC_SDA: U1.27(CDATA)  [also labelled PB9]
LINEIN_L: C19.1 LINE_IN.2(CHR) P1.2
LINEIN_R: C21.1 LINE_IN.1(CHL)
LINK_LED: EARTHNET.12(LED(Y)_A) R6.2 U2.25(LED1/PHYADD1)
MIC_N: C23.2 U1.23(RIN1)
MIC_P: C22.2 U1.24(LIN1)
PA1: R7.2  [also labelled RMII_REF_CLK]
PA3: R17.2  [also labelled PWM_DAC]
PA7: U2.26(CRS/CRS_DV)  [also labelled RMII_CRS_DV]
PC4: U2.9(RXD0)  [also labelled RMII_RXD0]
PC5: U2.10(RXD1)  [also labelled RMII_RXD1]
PG11: U2.20(TX_EN)  [also labelled RMII_TX_EN]
PG13: U2.16(TXD0)  [also labelled RMII_TXD0]
PG14: U2.17(TXD1)  [also labelled RMII_TXD1]
SPEED_LED: EARTHNET.9(LED(G)_A) R8.2 U2.24(LED0/PHYADD0)
SPK_IN: C12.2 C13.2 R12.2
TPRX+: EARTHNET.3(RD+) U2.5(TRXP1)
TPRX-: EARTHNET.6(RD-) U2.6(TRXN1)
TPTX+: EARTHNET.1(TD+) U2.3(TRXP0)
TPTX-: EARTHNET.2(TD-) U2.4(TRXN0)
NetC3_2: C3.2 C4.2 R2.2 U1.17(AVDD)
NetC7_2: C7.2 C8.1 L1.2 U2.7(AVDD33) U2.30(NC/AVDD33)
NetC10_1: C10.1(VCC) U1.12(LOUT1)
NetC10_2: C10.2(GND) PHONE.1(CHL)
NetC11_1: C11.1(VCC) U1.11(ROUT1)
NetC11_2: C11.2(GND) PHONE.2(CHR)
NetC12_1: C12.1 U1.15(LOUT2)
NetC13_1: C13.1 U1.14(ROUT2)
NetC14_1: C14.1 C15.2 R3.2 R5.2
NetC16_2: C16.2 U1.10(VREF)
NetC17_2: C17.2 U1.19(ADCVREF)
NetC18_2: C18.2 U1.20(VMID)
NetC19_2: C19.2 U1.22(LIN2)
NetC20_1: C20.1 C22.1 MIC1.1(+) R5.1
NetC21_2: C21.2 U1.21(RIN2)
NetC23_1: C23.1 MIC1.2(GND) R9.1
NetC24_2: C24.2 U2.32(XTAL_OUT) Y1.1(OSC1)
NetC25_2: C25.2 U2.31(XTAL_IN) Y1.2(OSC2)
NetC26_2: C26.2 U3.2(BYPASS) U3.3(IN+)
NetC28_2: C28.2 U2.2(AVDDL)
NetC29_2: C29.2 U2.29(DVDDL)
NetC30_1: C30.1 C31.1(VCC) R13.2 U3.6(VDD)
NetC32_2: C32.2 EARTHNET.4(TCT)
NetC33_2: C33.2 EARTHNET.5(RCT)
NetC34_2: C34.2 R17.1 R18.2
NetC35_2: C35.2 P1.1 R18.1
NetEARTHNET_10: EARTHNET.10(LED(G)_K) R15.1
NetEARTHNET_11: EARTHNET.11(LED(Y)_K) R16.1
NetR4_1: R4.1 U2.8(RX_DV)
NetR7_1: R7.1 U2.15(TXC)
NetR11_1: R11.1 U2.1(RBIAS)
NetR12_1: R12.1 R14.2 U3.4(IN-)
NetR14_1: R14.1 SP+.1 U3.5(VO1)
NetSP-_1: SP-.1 U3.8(VO2)

Not connected (* = marked no-connect by the designer): EARTHNET 7(NC); U1 9(NC) 25(NC); U2 11(RXD2/INT_N) 12(RXD3/CLK_CTL) 13(RXC) 18(TXD2) 19(TXD3) 27(COL) 28(RX_ER)

### Notes on the sheet
- EARTHNET
- I2S DAC&ADC
- SPK+和SPK-连接开发板自带的喇叭，在开发板底部。
- PWM DAC/AUDIO
- Title:
- Author:
- Date:
- Revision:
- Size:
- File:
- Version:

### Library data of the parts
C1-C7 C9 C12-C30 C32-C35 = C
C8 = C-0603-SMD
C10 C11 C31 = CAP
EARTHNET = HR911105
L1 = L
LINE_IN PHONE = PHONE_M
MIC1 = MIC-6022
P1 = Header 2: Header, 2-Pin; LatestRevisionDate: 17-Jul-2002; LatestRevisionNote: Re-released for DXP Platform.; Publisher: Altium Limited
R1-R10 R12-R18 = R
R11 = R: 贴片电阻
SP+ SP- = TEST-POINT: 测试点
U1 = ES8388: 24bit ADC&DAC 96Khz
U2 = YT8512C: 10M/100M 网络PHY RMII/MII
U3 = MD8002A: 5V, 3W, 功放IC
Y1 = XTAL: Crystal Oscillator; Published: 8-Jun-2000; LatestRevisionDate: 17-Jul-2002; LatestRevisionNote: Re-released for DXP Platform.; Publisher: Altium Limited

## Sheet POWER&USB_USART.SchDoc: Explorer STM32F407 Board
size A4; Author: ATOM@ALIENTEK; Revision: V3.4; SheetSize: A4
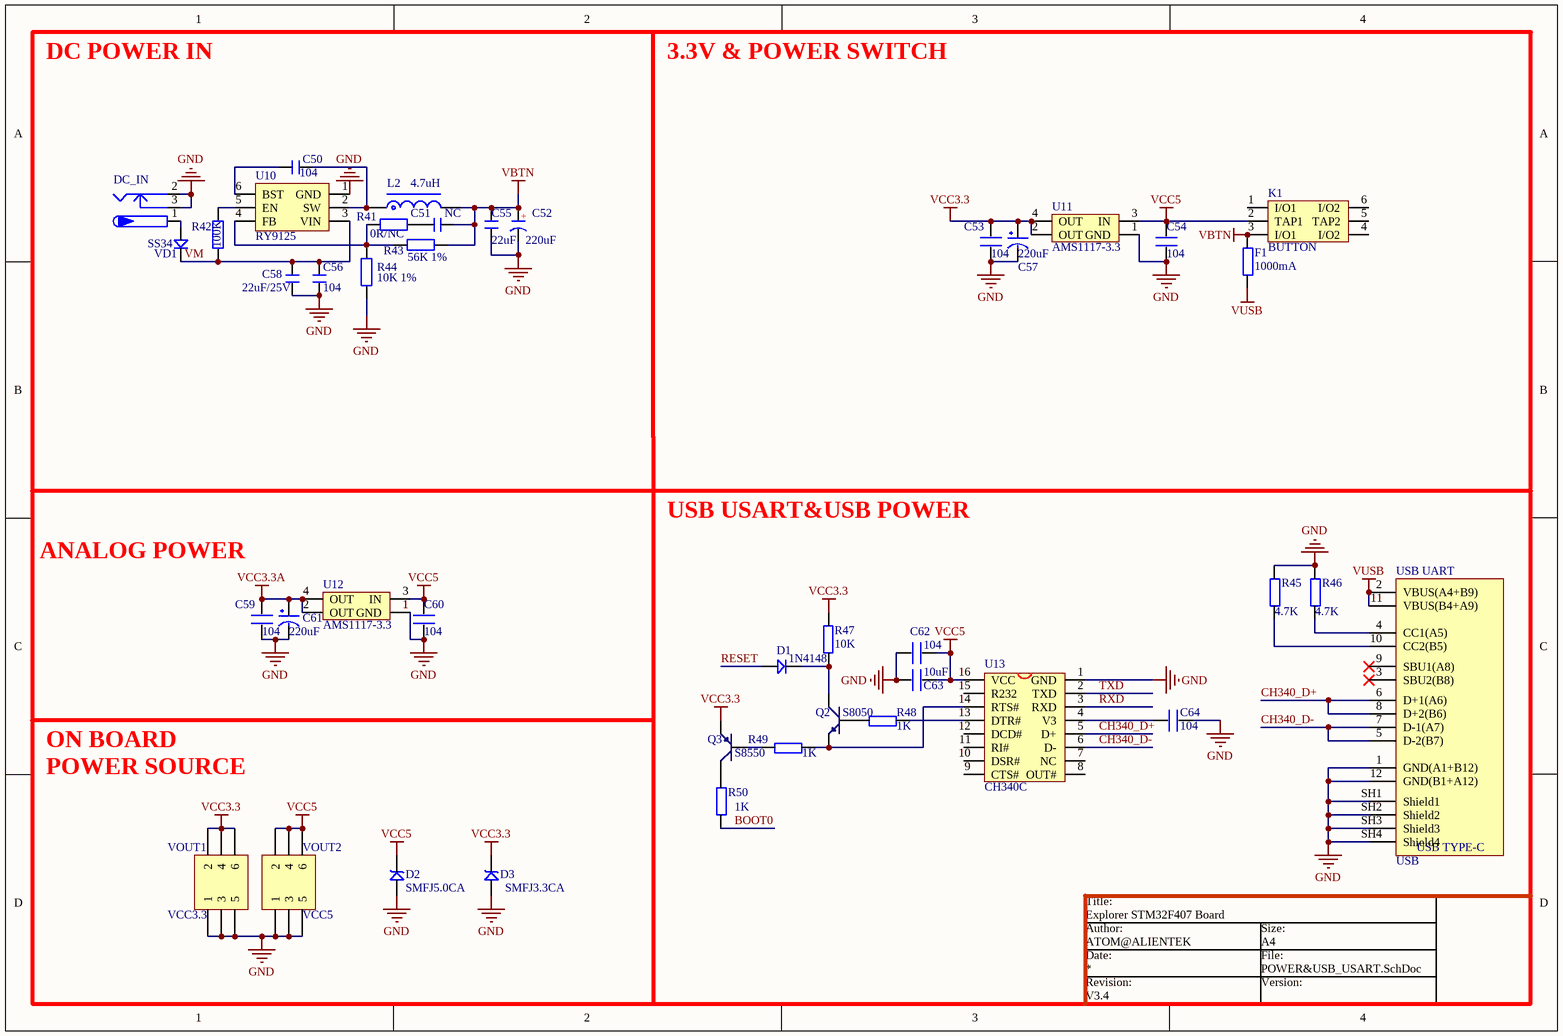
[diagram p5: POWER&USB_USART.SchDoc]

### Parts
C50  104  [0402]
C51  NC  [0402]
C52  220uF  [CM D(6.3*5.4)]
C53  104  [0402]
C54  104  [0402]
C55  22uF  [C 0805]
C56  104  [0402]
C57  220uF  [CC6.56.5]
C58  22uF/25V  [C 0805]
C59  104  [0402]
C60  104  [0402]
C61  220uF  [CC6.56.5]
C62  104  [0402]
C63  10uF  [0603P]
C64  104  [0402]
D1  1N4148  [DIODE_SOP]
D2  SMFJ5.0CA  [SOD-123]
D3  SMFJ3.3CA  [SOD-123]
DC_IN1  DC_IN  [DC10B]
F1  1000mA  [0805]
K1  BUTTON  [BTN8.5*8.5]
L2  4.7uH  [L-SMD-0420]
Q2  S8050  [SOT-23R]
Q3  S8550  [SOT-23R]
R41  0R/NC  [0402]
R42  100K  [0402]
R43  56K 1%  [0402]
R44  10K 1%  [0402]
R45  4.7K  [0402]
R46  4.7K  [0402]
R47  10K  [0402]
R48  1K  [0402]
R49  1K  [0402]
R50  1K  [0402]
U10  RY9125  [SOT23-6N]
U11  AMS1117-3.3  [AMS1117]
U12  AMS1117-3.3  [AMS1117]
U13  CH340C  [SOP16M]
USB_UART  USB  [USB Type-C]
VD1  SS34  [SMA]
VOUT1  VCC3.3  [HDR2X3]
VOUT2  VCC5  [HDR2X3]

### Nets
GND: C52.2(K) C53.1 C54.1 C55.2 C56.1 C57.2(GND) C58.1 C59.1 C60.1 C61.2(GND) C62.1 C63.1 C64.2 D2.1 D3.1 DC_IN1.2 DC_IN1.3 R44.2 R45.2 R46.2 U10.1(GND) U11.1(GND) U12.1(GND) U13.1(GND) USB_UART.1(GND(A1+B12)) USB_UART.12(GND(B1+A12)) USB_UART.SH1(Shield1) USB_UART.SH2(Shield2) USB_UART.SH3(Shield3) USB_UART.SH4(Shield4) VOUT1.1 VOUT1.3 VOUT1.5 VOUT2.1 VOUT2.3 VOUT2.5
VBTN: C51.2 C52.1(A) C55.1 F1.2 K1.3(I/O1) L2.2 R43.2
VCC3.3: C53.2 C57.1(VCC) D3.2 Q3.1(E) R47.1 U11.2(OUT) U11.4(OUT) VOUT1.2 VOUT1.4 VOUT1.6
VCC3.3A: C59.2 C61.1(VCC) U12.2(OUT) U12.4(OUT)
VCC5: C54.2 C60.2 C62.2 C63.2 D2.2 K1.2(TAP1) U11.3(IN) U12.3(IN) U13.16(VCC) VOUT2.2 VOUT2.4 VOUT2.6
VUSB: F1.1 USB_UART.2(VBUS(A4+B9)) USB_UART.11(VBUS(B4+A9))
BOOT0: R50.1
CH340_D+: U13.5(D+) USB_UART.6(D+1(A6)) USB_UART.8(D+2(B6))
CH340_D-: U13.6(D-) USB_UART.5(D-2(B7)) USB_UART.7(D-1(A7))
RESET: D1.1
RXD: U13.3(RXD)
TXD: U13.2(TXD)
VM: C56.2 C58.2 R42.2 U10.3(VIN) VD1.2(K)
NetC50_1: C50.1 U10.6(BST)
NetC50_2: C50.2 L2.1 U10.2(SW)
NetC51_1: C51.1 R41.2
NetC64_1: C64.1 U13.4(V3)
NetD1_2: D1.2 Q2.3(C) R47.2
NetDC_IN1_1: DC_IN1.1 VD1.1(A)
NetQ2_1: Q2.1(E) R49.2 U13.14(RTS#)
NetQ2_2: Q2.2(B) R48.1
NetQ3_2: Q3.2(B) R49.1
NetQ3_3: Q3.3(C) R50.2
NetR41_1: R41.1 R43.1 R44.1 U10.4(FB)
NetR42_1: R42.1 U10.5(EN)
NetR45_1: R45.1 USB_UART.10(CC2(B5))
NetR46_1: R46.1 USB_UART.4(CC1(A5))
NetR48_2: R48.2 U13.13(DTR#)

Not connected (* = marked no-connect by the designer): K1 1(I/O1) 4(I/O2) 5(TAP2) 6(I/O2); U13 7(NC) 8(OUT#) 9(CTS#) 10(DSR#) 11(RI#) 12(DCD#) 15(R232); USB_UART 3(SBU2(B8))* 9(SBU1(A8))*

### Notes on the sheet
- DC POWER IN
- 3.3V & POWER SWITCH
- USB USART&USB POWER
- ANALOG POWER
- POWER SOURCE
- ON BOARD
- Title:
- Author:
- Date:
- Revision:
- Size:
- File:
- Version:
- (in symbol C-CM) +
- (in symbol USB Type-C) USB TYPE-C

### Library data of the parts
C50 C51 C55 = C: 无极性贴片电容; 版权归属: 源创客; BOM名称: 无极性贴片电容; 学习资源: www.ooocke.com
C52 = C-CM: 贴片电解电容; 版权归属: 源创客; BOM名称: 贴片电解电容; 学习资源: www.ooocke.com
C53 C54 C59 C60 C62-C64 = C
C56 C58 = C: 无极性贴片电容,25V; 版权归属: 源创客; BOM名称: 无极性贴片电容; 学习资源: www.ooocke.com
C57 C61 = CAP
D1 = D
D2 D3 = SMBJ: TVS
DC_IN1 = P-DC: 低压电源接口; BOM名称: DC电源接口; 版权归属: 源创客; 学习资源: www.ooocke.com
F1 R45-R50 = R
L2 = L-CDRH: 功率屏蔽电感; 版权归属: 源创客; BOM名称: 功率屏蔽电感; 学习资源: www.ooocke.com
Q2 = NPN: 8050/BCW846/BCW847
Q3 = PNP: 8550/BCW68
R41-R44 = R: 贴片电阻; 版权归属: 源创客; BOM名称: 贴片电阻; 学习资源: www.ooocke.com
U10 = DC JW5060T_6: DC降压芯片
U11 U12 = AMS1117
U13 = CH340C: USB2UART
USB_UART = USB Type-C: 12P TypeC 母座
VD1 = SS14: 肖特基二极管; 版权归属: 源创客; 属性: 40V/1A; BOM名称: 肖特基二极管; 学习资源: www.ooocke.com
VOUT1 VOUT2 = Header 3X2: Header, 3-Pin, Dual row; LatestRevisionDate: 17-Jul-2002; LatestRevisionNote: Re-released for DXP Platform.; Publisher: Altium Limited

## Nets that join several sheets
GND: CORE_ABC (36 pins), CORE_DEFG (21 pins), DEVICE1 (47 pins), DEVICE2 (19 pins), AUDIO&ETHNET (31 pins), POWER&USB_USART (36 pins)
VCC3.3: CORE_ABC (R51.2 R53.2 R56.1 R57.1), CORE_DEFG (9 pins), DEVICE1 (29 pins), DEVICE2 (18 pins), AUDIO&ETHNET (9 pins), POWER&USB_USART (10 pins)
VCC3.3A: AUDIO&ETHNET (5 pins), POWER&USB_USART (C59.2 C61.1 U12.2 U12.4)
VCC3.3M: CORE_ABC (28 pins), CORE_DEFG (5 pins)
VCC5: CORE_DEFG (C91.2 TFTLCD.28), DEVICE1 (C45.1 MOS1.2 R39.1 U7.3), DEVICE2 (C93.1 U17.6), AUDIO&ETHNET (R13.1), POWER&USB_USART (12 pins)
VUSB: DEVICE1 (USB_SLAVE.2 USB_SLAVE.11), POWER&USB_USART (F1.1 USB_UART.2 USB_UART.11)
1WIRE_DQ: CORE_DEFG (P9.14 U14.124), DEVICE1 (P3.18), DEVICE2 (R75.1 U19.2)
3D_INT: CORE_ABC (U14.26), CORE_DEFG (P8.19), DEVICE2 (U17.1)
BEEP: CORE_DEFG (P8.18 U14.20), DEVICE2 (R64.1)
BOOT0: CORE_ABC (U14.138), DEVICE2 (R73.2), POWER&USB_USART (R50.1)
BOOT1: CORE_ABC (U14.48), CORE_DEFG (P8.33 TFTLCD.29), DEVICE2 (R74.1)
DCMI__SCL: CORE_DEFG (P9.16 U14.122), DEVICE1 (P3.4 R19.1)
DCMI__SDA: CORE_DEFG (P9.15 U14.123), DEVICE1 (P3.6 R20.1)
DCMI__XCLK: CORE_ABC (U14.100), CORE_DEFG (P9.27), DEVICE1 (P3.17), DEVICE2 (R70.1)
DCMI_D0: CORE_ABC (U14.96), CORE_DEFG (P9.31), DEVICE1 (P3.8), AUDIO&ETHNET (U1.1)
DCMI_D1: CORE_ABC (U14.97), CORE_DEFG (P9.30), DEVICE1 (P3.9)
DCMI_D2: CORE_ABC (U14.98), CORE_DEFG (P9.29), DEVICE1 (P3.10 R29.2 TF_CARD.7)
DCMI_D3: CORE_ABC (U14.99), CORE_DEFG (P9.28), DEVICE1 (P3.11 R31.2 TF_CARD.8)
DCMI_D4: CORE_ABC (U14.112), CORE_DEFG (P9.22), DEVICE1 (P3.12 R22.2 TF_CARD.2)
DCMI_D5: CORE_ABC (U14.136), CORE_DEFG (P9.4), DEVICE1 (P3.13)
DCMI_D6: CORE_DEFG (P8.5 U14.4), DEVICE1 (P3.14)
DCMI_D7: CORE_DEFG (P8.8 U14.5), DEVICE1 (P3.15)
DCMI_HREF: CORE_ABC (U14.40), CORE_DEFG (P8.25), DEVICE1 (P3.5), DEVICE2 (P11.3)
DCMI_PCLK: CORE_ABC (U14.42), CORE_DEFG (P8.27), DEVICE1 (P3.16)
DCMI_RESET: CORE_DEFG (P9.8 U14.132), DEVICE1 (P3.7)
DCMI_VSYNC: CORE_ABC (U14.137), CORE_DEFG (P9.3), DEVICE1 (P3.3)
ETH_MDC: CORE_ABC (U14.27), CORE_DEFG (P8.22), AUDIO&ETHNET (U2.22)
ETH_MDIO: CORE_ABC (U14.36), DEVICE1 (P4.3), AUDIO&ETHNET (U2.23)
ETH_RESET: CORE_DEFG (P9.19 U14.117), AUDIO&ETHNET (C27.2 R10.1 U2.21)
F_CS: CORE_ABC (U14.75), CORE_DEFG (P9.43), DEVICE1 (U8.1)
GBC_KEY: CORE_DEFG (P8.16 U14.18), DEVICE2 (U17.2)
GBC_RX: DEVICE1 (P2.6), DEVICE2 (U17.3)
GBC_TX: DEVICE1 (P2.5), DEVICE2 (U17.4)
I2S_LRCK: CORE_ABC (U14.73), CORE_DEFG (P8.44), AUDIO&ETHNET (U1.7)
I2S_SCLK: CORE_ABC (U14.74), CORE_DEFG (P8.41), AUDIO&ETHNET (U1.5)
I2S_SDIN: CORE_ABC (U14.29), CORE_DEFG (P8.24), AUDIO&ETHNET (U1.6)
I2S_SDOUT: CORE_ABC (U14.28), CORE_DEFG (P8.21), AUDIO&ETHNET (U1.8)
IIC_SCL: CORE_ABC (U14.139), CORE_DEFG (P9.2), DEVICE1 (R25.1 U5.6 U9.B3), AUDIO&ETHNET (U1.28)
IIC_SDA: CORE_ABC (U14.140), CORE_DEFG (P9.1), DEVICE1 (R27.1 U5.5 U9.C3), AUDIO&ETHNET (U1.27)
JTCK: CORE_ABC (U14.109), CORE_DEFG (JTAG.9 P9.25 R63.1)
JTDI: CORE_ABC (U14.110), CORE_DEFG (JTAG.5 P9.24 R60.1), DEVICE1 (R40.2)
JTDO: CORE_ABC (U14.133), CORE_DEFG (JTAG.13 P9.7 R62.1), DEVICE1 (U8.6), DEVICE2 (U16.5)
JTMS: CORE_ABC (U14.105), CORE_DEFG (JTAG.7 P9.26 R61.1)
JTRST: CORE_ABC (U14.134), CORE_DEFG (JTAG.3 P9.6 R59.1), DEVICE1 (U8.2), DEVICE2 (U16.7)
KEY0: CORE_DEFG (P8.6 U14.3), DEVICE2 (KEY0.2)
KEY1: CORE_DEFG (P8.3 U14.2), DEVICE2 (KEY1.2)
KEY2: CORE_DEFG (P8.4 U14.1), DEVICE2 (KEY2.2)
LCD_BL: CORE_ABC (U14.76), CORE_DEFG (P9.42 TFTLCD.23)
LED0: CORE_DEFG (P8.17 U14.21), DEVICE2 (DS0.2)
LED1: CORE_DEFG (P8.20 U14.22), DEVICE2 (DS1.2)
LIGHT_SENSOR: CORE_DEFG (P8.15 U14.19), DEVICE2 (R78.1)
NRF_CE: CORE_DEFG (P9.34 U14.91), DEVICE2 (U16.3)
NRF_CS: CORE_DEFG (P9.33 U14.92), DEVICE2 (U16.4)
NRF_IRQ: CORE_DEFG (P9.32 U14.93), DEVICE1 (U6.2 U6.3), DEVICE2 (R66.1)
PA0: CORE_ABC (U14.34), CORE_DEFG (P8.26), DEVICE2 (KEY_UP.2)
PA1: CORE_ABC (U14.35), CORE_DEFG (P8.23), AUDIO&ETHNET (R7.2)
PA3: CORE_ABC (U14.37), DEVICE1 (P4.4), AUDIO&ETHNET (R17.2)
PA5: CORE_ABC (U14.41), CORE_DEFG (P8.28), DEVICE2 (P11.2)
PA7: CORE_ABC (U14.43), CORE_DEFG (P8.30), AUDIO&ETHNET (U2.26)
PA9: CORE_ABC (U14.101), CORE_DEFG (P10.3)
PA10: CORE_ABC (U14.102), CORE_DEFG (P10.1)
PA11: CORE_ABC (U14.103), DEVICE1 (P5.3)
PA12: CORE_ABC (U14.104), DEVICE1 (P5.4)
PB0: CORE_ABC (U14.46), CORE_DEFG (P8.31 TFTLCD.34)
PB1: CORE_ABC (U14.47), CORE_DEFG (P8.34 TFTLCD.31)
PB5: CORE_ABC (U14.135), CORE_DEFG (P9.5), DEVICE1 (U8.5), DEVICE2 (U16.6)
PB10: CORE_ABC (U14.69), DEVICE1 (P2.4)
PB11: CORE_ABC (U14.70), DEVICE1 (P2.3)
PC4: CORE_ABC (U14.44), CORE_DEFG (P8.29), AUDIO&ETHNET (U2.9)
PC5: CORE_ABC (U14.45), CORE_DEFG (P8.32), AUDIO&ETHNET (U2.10)
PC10: CORE_ABC (U14.111), CORE_DEFG (P9.23), DEVICE1 (R21.2 TF_CARD.1)
PC12: CORE_ABC (U14.113), CORE_DEFG (P9.21), DEVICE1 (R28.2)
PC13: CORE_ABC (U14.7), CORE_DEFG (P8.7 TFTLCD.33)
PD2: CORE_DEFG (P9.20 U14.116), DEVICE1 (R23.2 TF_CARD.3)
PG11: CORE_DEFG (P9.12 U14.126), AUDIO&ETHNET (U2.20)
PG13: CORE_DEFG (P9.10 U14.128), AUDIO&ETHNET (U2.16)
PG14: CORE_DEFG (P9.9 U14.129), AUDIO&ETHNET (U2.17)
RESET: CORE_ABC (C65.2 R51.1 RESET.1 U14.25), CORE_DEFG (JTAG.15 TFTLCD.5), POWER&USB_USART (D1.1)
RXD: CORE_DEFG (P10.4), POWER&USB_USART (U13.3)
TXD: CORE_DEFG (P10.2), POWER&USB_USART (U13.2)